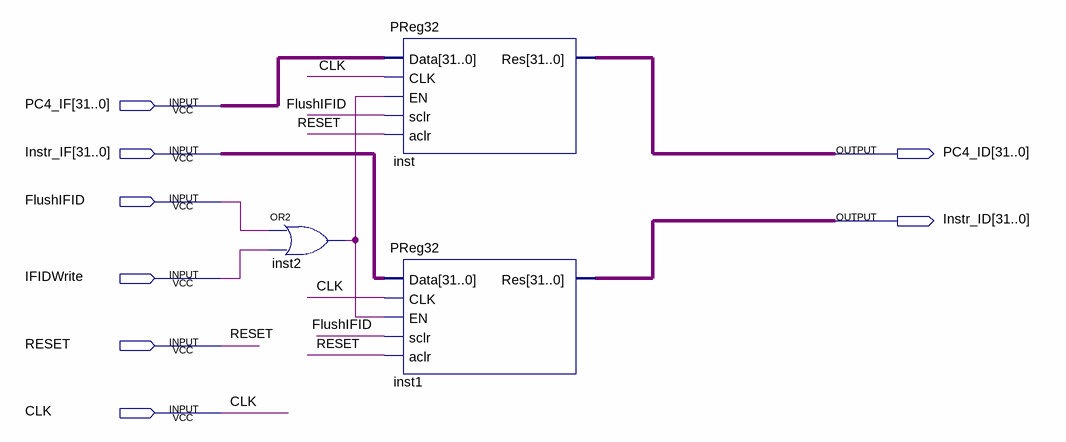
[diagram p0: schematic sheet]
// Quartus schematic IF_ID.bdf as structural Verilog: 3 symbols, 8 pins
module IF_ID (
  input  [31:0] PC4_IF,
  input  [31:0] Instr_IF,
  input  FlushIFID,
  input  IFIDWrite,
  input  RESET,
  input  CLK,
  output [31:0] PC4_ID,
  output [31:0] Instr_ID
);

  wire inst2_out;

  or inst2 (inst2_out, FlushIFID, IFIDWrite);
  PReg32 inst (.Data(PC4_IF), .CLK(CLK), .EN(inst2_out), .sclr(FlushIFID), .aclr(RESET), .Res(PC4_ID));
  PReg32 inst1 (.Data(Instr_IF), .CLK(CLK), .EN(inst2_out), .sclr(FlushIFID), .aclr(RESET), .Res(Instr_ID));
endmodule
